# Altium schematic sheet AnalogCircuits.SchDoc
size 297 x 209 mm
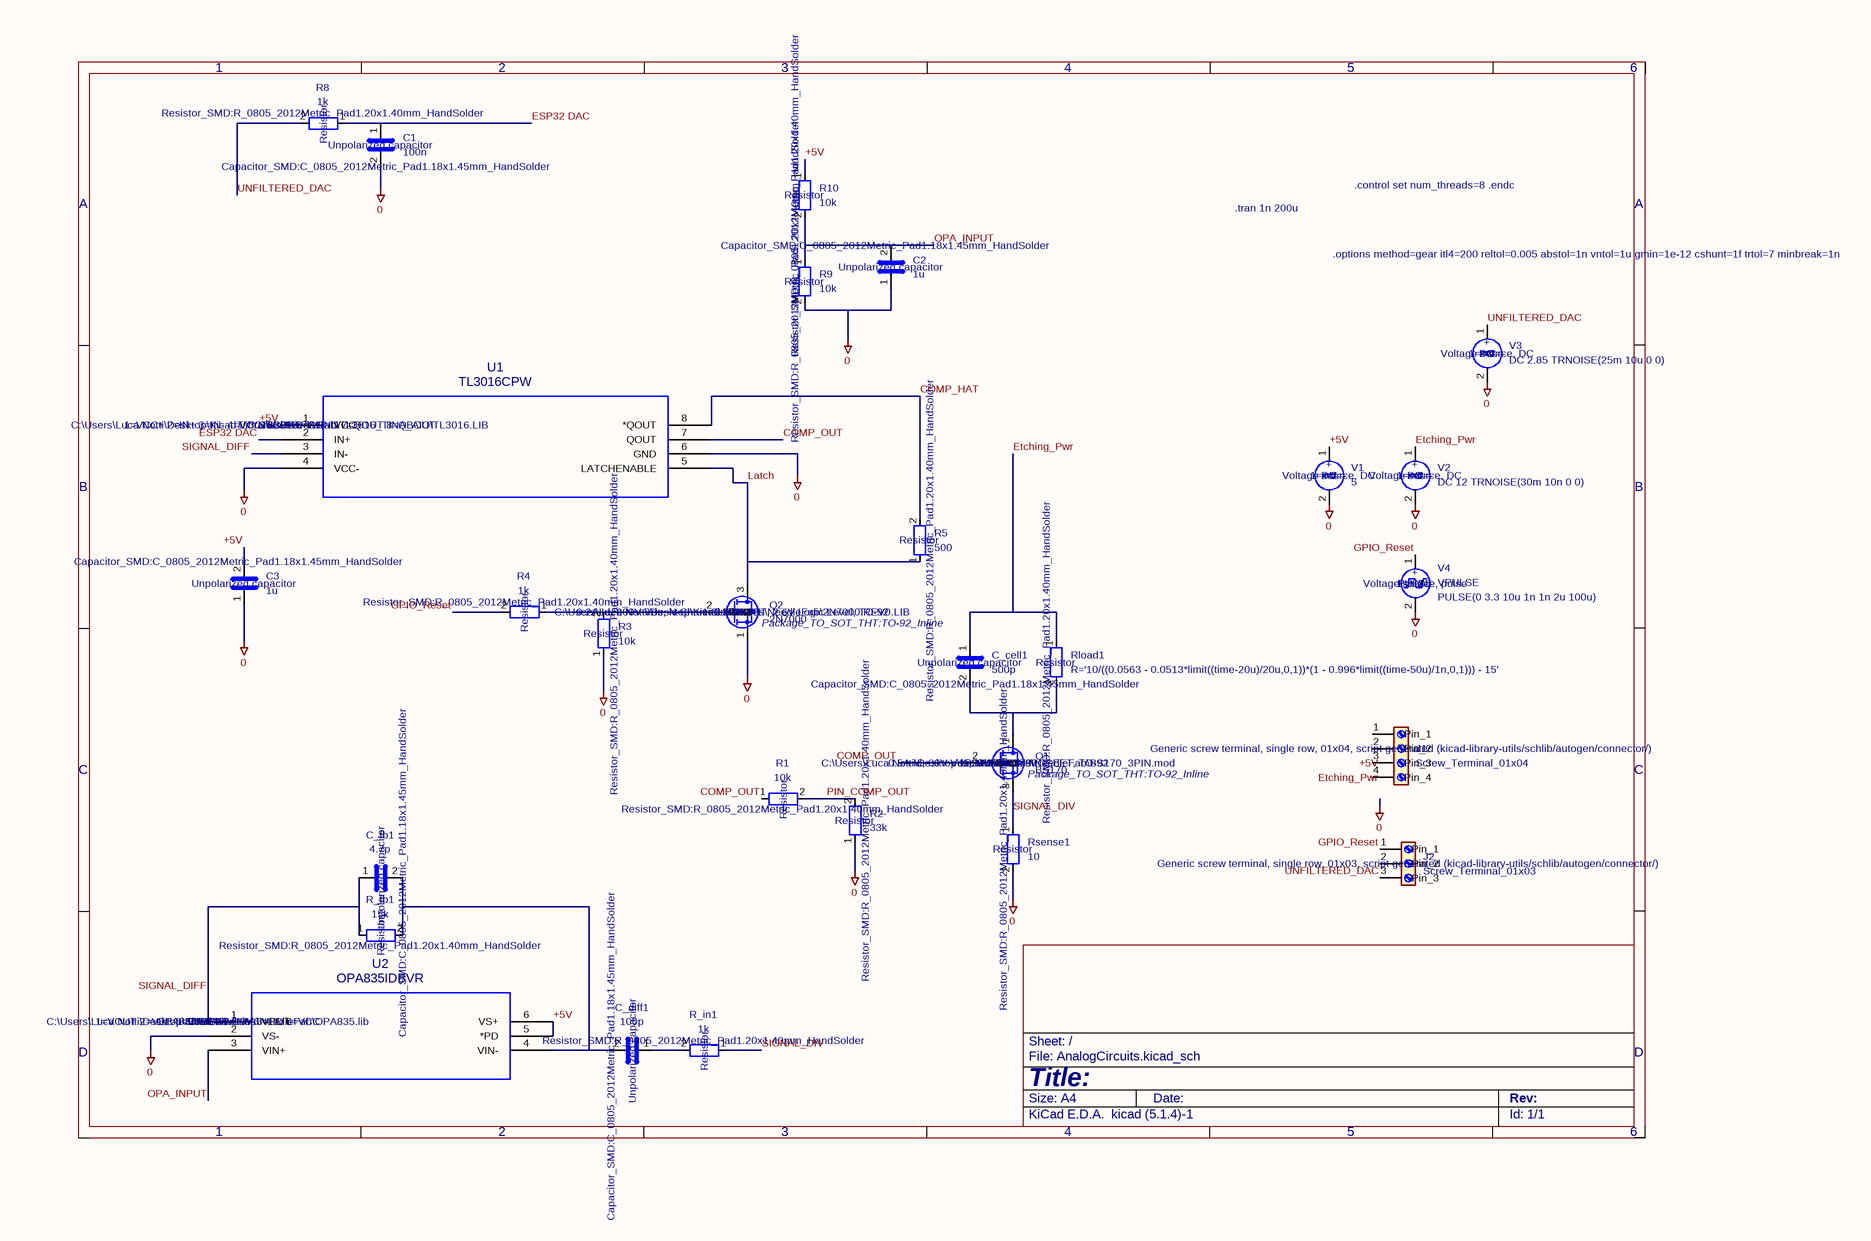
[diagram p0: AnalogCircuits.SchDoc]

## Parts
C1  Description: Unpolarized capacitor  Footprint: Capacitor_SMD:C_0805_2012Metric_Pad1.18x1.45mm_HandSolder  [C_0805_2012Metric_Pad1.18x1.45mm_HandSolder]  (hidden comment: 100n)
C2  Description: Unpolarized capacitor  Footprint: Capacitor_SMD:C_0805_2012Metric_Pad1.18x1.45mm_HandSolder  [C_0805_2012Metric_Pad1.18x1.45mm_HandSolder]  (hidden comment: 1u)
C3  Description: Unpolarized capacitor  Footprint: Capacitor_SMD:C_0805_2012Metric_Pad1.18x1.45mm_HandSolder  [C_0805_2012Metric_Pad1.18x1.45mm_HandSolder]  (hidden comment: 1u)
C_cell1  Description: Unpolarized capacitor  Footprint: Capacitor_SMD:C_0805_2012Metric_Pad1.18x1.45mm_HandSolder  [C_0805_2012Metric_Pad1.18x1.45mm_HandSolder]  (hidden comment: 500p)
C_diff1  Description: Unpolarized capacitor  Footprint: Capacitor_SMD:C_0805_2012Metric_Pad1.18x1.45mm_HandSolder  [C_0805_2012Metric_Pad1.18x1.45mm_HandSolder]  (hidden comment: 100p)
C_fb1  Description: Unpolarized capacitor  Footprint: Capacitor_SMD:C_0805_2012Metric_Pad1.18x1.45mm_HandSolder  [C_0805_2012Metric_Pad1.18x1.45mm_HandSolder]  (hidden comment: 4.7p)
J1  Description: Generic screw terminal, single row, 01x04, script generated (kicad-library-utils/schlib/autogen/connector/)  (hidden comment: Screw_Terminal_01x04)
J2  Description: Generic screw terminal, single row, 01x03, script generated (kicad-library-utils/schlib/autogen/connector/)  (hidden comment: Screw_Terminal_01x03)
Q1  Description: 0.5A Id, 60V Vds, N-Channel MOSFET, TO-92  Sim.Library: C:\Users\Luca Notti\Desktop\Kicad Libraries\NeedleFab\BS170_3PIN.mod  Sim.Name: BS/MMBF170  Sim.Device: SUBCKT  Sim.Pins: 1=20 2=10 3=30  Footprint: Package_TO_SOT_THT:TO-92_Inline  [TO-92_Inline]  (hidden comment: BS170)
Q2  Description: 0.2A Id, 200V Vds, N-Channel MOSFET, 2.6V Logic Level, TO-92  Sim.Library: C:\Users\Luca Notti\Desktop\Kicad Libraries\NeedleFab\2N7000.REV0.LIB  Sim.Device: SUBCKT  Sim.Pins: 1=3 2=2 3=1  Footprint: Package_TO_SOT_THT:TO-92_Inline  [TO-92_Inline]  (hidden comment: 2N7000)
R1  Description: Resistor  Footprint: Resistor_SMD:R_0805_2012Metric_Pad1.20x1.40mm_HandSolder  [R_0805_2012Metric_Pad1.20x1.40mm_HandSolder]  (hidden comment: 10k)
R2  Description: Resistor  Footprint: Resistor_SMD:R_0805_2012Metric_Pad1.20x1.40mm_HandSolder  [R_0805_2012Metric_Pad1.20x1.40mm_HandSolder]  (hidden comment: 33k)
R3  Description: Resistor  Footprint: Resistor_SMD:R_0805_2012Metric_Pad1.20x1.40mm_HandSolder  [R_0805_2012Metric_Pad1.20x1.40mm_HandSolder]  (hidden comment: 10k)
R4  Description: Resistor  Footprint: Resistor_SMD:R_0805_2012Metric_Pad1.20x1.40mm_HandSolder  [R_0805_2012Metric_Pad1.20x1.40mm_HandSolder]  (hidden comment: 1k)
R5  Description: Resistor  Footprint: Resistor_SMD:R_0805_2012Metric_Pad1.20x1.40mm_HandSolder  [R_0805_2012Metric_Pad1.20x1.40mm_HandSolder]  (hidden comment: 500)
R8  Description: Resistor  Footprint: Resistor_SMD:R_0805_2012Metric_Pad1.20x1.40mm_HandSolder  [R_0805_2012Metric_Pad1.20x1.40mm_HandSolder]  (hidden comment: 1k)
R9  Description: Resistor  Footprint: Resistor_SMD:R_0805_2012Metric_Pad1.20x1.40mm_HandSolder  [R_0805_2012Metric_Pad1.20x1.40mm_HandSolder]  (hidden comment: 10k)
R10  Description: Resistor  Footprint: Resistor_SMD:R_0805_2012Metric_Pad1.20x1.40mm_HandSolder  [R_0805_2012Metric_Pad1.20x1.40mm_HandSolder]  (hidden comment: 10k)
R_fb1  Description: Resistor  Footprint: Resistor_SMD:R_0805_2012Metric_Pad1.20x1.40mm_HandSolder  [R_0805_2012Metric_Pad1.20x1.40mm_HandSolder]  (hidden comment: 15k)
R_in1  Description: Resistor  Footprint: Resistor_SMD:R_0805_2012Metric_Pad1.20x1.40mm_HandSolder  [R_0805_2012Metric_Pad1.20x1.40mm_HandSolder]  (hidden comment: 1k)
Rload1  Description: Resistor  Footprint: Resistor_SMD:R_0805_2012Metric_Pad1.20x1.40mm_HandSolder  [R_0805_2012Metric_Pad1.20x1.40mm_HandSolder]  (hidden comment: R='10/((0.0563 - 0.0513*limit((time-20u)/20u,0,1))*(1 - 0.996*limit((time-50u)/1n,0,1))) - 15')
Rsense1  Description: Resistor  Footprint: Resistor_SMD:R_0805_2012Metric_Pad1.20x1.40mm_HandSolder  [R_0805_2012Metric_Pad1.20x1.40mm_HandSolder]  (hidden comment: 10)
U1  Sim.Library: C:\Users\Luca Notti\Desktop\Kicad Libraries\NeedleFab\TL3016_TINA_AIO\TL3016.LIB  Sim.Name: TL3016  Sim.Device: SUBCKT  Sim.Pins: 1=VCC+ 2=IN+ 3=IN- 4=VCC- 5=LE 6=GRND 7=QOUT 8=QBOUT  Footprint: TL3016CPW:PW8  [PW8]  (hidden comment: TL3016CPW)
U2  Sim.Library: C:\Users\Luca Notti\Desktop\Kicad Libraries\NeedleFab\OPA835.lib  Sim.Name: OPA835  Sim.Device: SUBCKT  Sim.Pins: 1=VOUT 2=VEE 3=VINP 4=VINM 5=PD 6=VCC  Footprint: OPA835IDBVR:DBV6  [DBV6]  (hidden comment: OPA835IDBVR)
V1  Description: Voltage source, DC  Sim.Pins: 1=+ 2=-  Sim.Type: DC  Sim.Device: V  (hidden comment: 5)
V2  Description: Voltage source, DC  Sim.Pins: 1=+ 2=-  Sim.Type: DC  Sim.Device: V  (hidden comment: DC 12 TRNOISE(30m 10n 0 0))
V3  Description: Voltage source, DC  Sim.Pins: 1=+ 2=-  Sim.Type: DC  Sim.Device: V  (hidden comment: DC 2.85 TRNOISE(25m 10u 0 0))
V4  Description: Voltage source, pulse  Sim.Pins: 1=+ 2=-  Sim.Type: PULSE  Sim.Device: V  Sim.Params: PULSE(0 3.3 10u 1n 1n 2u 100u)  (hidden comment: VPULSE)

## Nets
0: C1.2 C2.1 C3.1 Q2.1(S) R2.1 R3.1 R9.2 Rsense1.2 U1.4(VCC-) U1.6(GND) U2.2(VS-) V1.2 V2.2 V3.2 V4.2
+5V: C3.2 R10.1 U1.1(VCC+) U2.5(*PD) U2.6(VS+) V1.1
COMP_HAT: R5.2 U1.8(*QOUT)
COMP_OUT: Q1.2(G) R1.1 U1.7(QOUT)
ESP32 DAC: C1.1 R8.1 U1.2(IN+)
Etching_Pwr: C_cell1.1 Rload1.1 V2.1
GPIO_Reset: J2.1(Pin_1) R4.2 V4.1
Latch: Q2.3(D) R5.1 U1.5(LATCHENABLE)
OPA_INPUT: C2.2 R9.1 R10.2 U2.3(VIN+)
PIN_COMP_OUT: R1.2 R2.2
SIGNAL_DIFF: C_fb1.1 R_fb1.1 U1.3(IN-) U2.1(VOUT)
SIGNAL_DIV: Q1.3(S) R_in1.1 Rsense1.1
UNFILTERED_DAC: J2.3(Pin_3) R8.2 V3.1
NetC_cell1_2: C_cell1.2 Q1.1(D) Rload1.2
NetC_diff1_1: C_diff1.1 R_in1.2
NetC_diff1_2: C_diff1.2 C_fb1.2 R_fb1.2 U2.4(VIN-)
NetQ2_2: Q2.2(G) R3.2 R4.1

Not connected (* = marked no-connect by the designer): J1 1(Pin_1) 2(Pin_2) 3(Pin_3) 4(Pin_4); J2 2(Pin_2)

## Notes on the sheet
- .tran 1n 200u
- .control
  set num_threads=8
  .endc
- .options method=gear itl4=200 reltol=0.005 abstol=1n vntol=1u gmin=1e-12 cshunt=1f trtol=7 minbreak=1n
- Labels drawn without touching a wire or pin: +5V, Etching_Pwr
- 1
- 2
- 3
- 4
- 5
- 6
- A
- B
- C
- D
- Title:
- File: AnalogCircuits.kicad_sch
- Sheet: /
- KiCad E.D.A.  kicad (5.1.4)-1
- Size: A4
- Date:
- Rev:
- Id: 1/1
- (in symbol VDC) +
- (in symbol VPULSE) +

## Library data of the parts
C1-C3 C_cell1 C_diff1 C_fb1 = C
  C1: Value: 100n
  C2 C3: Value: 1u
  C_cell1: Value: 500p
  C_diff1: Value: 100p
  C_fb1: Value: 4.7p
R1-R5 R8-R10 R_fb1 R_in1 Rload1 Rsense1 = R
  R1 R3 R9 R10: Value: 10k
  R2: Value: 33k
  R4 R8 R_in1: Value: 1k
  R5: Value: 500
  R_fb1: Value: 15k
  Rload1: Value: R='10/((0.0563 - 0.0513*limit((time-20u)/20u,0,1))*(1 - 0.996*limit((time-50u)/1n,0,1))) - 15'
  Rsense1: Value: 10
V1-V3 = VDC
  V1: Value: 5
  V2: Value: DC 12 TRNOISE(30m 10n 0 0)
  V3: Value: DC 2.85 TRNOISE(25m 10u 0 0)
J1 = Screw_Terminal_01x04: Value: Screw_Terminal_01x04
J2 = Screw_Terminal_01x03: Value: Screw_Terminal_01x03
Q1 = BS170: Value: BS170
Q2 = 2N7000: Sim.Name: 2n7000; Value: 2N7000
U1 = TL3016CPW: Value: TL3016CPW
U2 = OPA835IDBVR: Value: OPA835IDBVR
V4 = VPULSE: Value: VPULSE